# Altium schematic sheet Top_Sheet.SchDoc
size A4; SheetNumber: 1; SheetTotal: 3
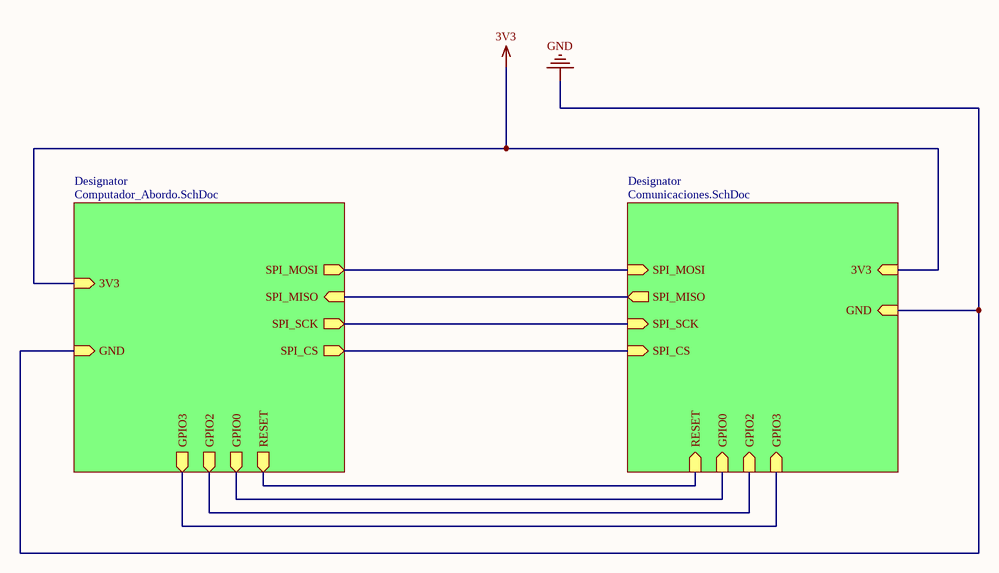
[diagram p0: Top_Sheet.SchDoc]

## Sub-sheets
Designator = Computador_Abordo.SchDoc: SPI_CS (out), SPI_SCK (out), SPI_MISO (in), SPI_MOSI (out), RESET (out), GPIO0 (out), GPIO2 (out), GPIO3 (out), 3V3 (in), GND (in)
Designator = Comunicaciones.SchDoc: SPI_MOSI (in), SPI_MISO (out), SPI_SCK (in), SPI_CS (in), RESET (in), GPIO0 (in), GPIO2 (in), GPIO3 (in), 3V3 (in), GND (in)

## Nets
3V3: sheet Designator/3V3, sheet Designator/3V3
GND: sheet Designator/GND, sheet Designator/GND
(unnamed): sheet Designator/SPI_CS, sheet Designator/SPI_CS
(unnamed): sheet Designator/SPI_SCK, sheet Designator/SPI_SCK
(unnamed): sheet Designator/SPI_MISO, sheet Designator/SPI_MISO
(unnamed): sheet Designator/SPI_MOSI, sheet Designator/SPI_MOSI
(unnamed): sheet Designator/RESET, sheet Designator/RESET
(unnamed): sheet Designator/GPIO0, sheet Designator/GPIO0
(unnamed): sheet Designator/GPIO2, sheet Designator/GPIO2
(unnamed): sheet Designator/GPIO3, sheet Designator/GPIO3